# Altium schematic sheet DIOT_SMA_Supply.SchDoc: =DocumentName
size A4; ModifiedBy: -; CheckedDate: -; DivGrp: WUT ISE; Designer: G.Kasprowicz; DocumentNumber: 1; Revision: 0; SheetNumber: 6; SheetTotal: 17
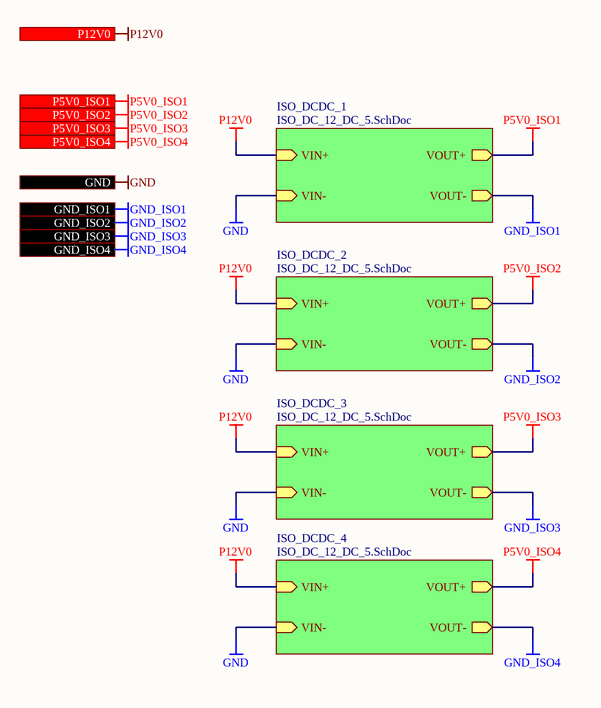
[diagram p0: DIOT_SMA_Supply.SchDoc]

## Sub-sheets
ISO_DCDC_1 = ISO_DC_12_DC_5.SchDoc: VIN+ (in), VIN- (in), VOUT+ (out), VOUT- (out)
ISO_DCDC_2 = ISO_DC_12_DC_5.SchDoc: VIN+ (in), VIN- (in), VOUT+ (out), VOUT- (out)
ISO_DCDC_3 = ISO_DC_12_DC_5.SchDoc: VIN+ (in), VIN- (in), VOUT+ (out), VOUT- (out)
ISO_DCDC_4 = ISO_DC_12_DC_5.SchDoc: VIN+ (in), VIN- (in), VOUT+ (out), VOUT- (out)

## Ports
GND, GND_ISO1, GND_ISO2, GND_ISO3, GND_ISO4, P5V0_ISO1 (out), P5V0_ISO2 (out), P5V0_ISO3 (out), P5V0_ISO4 (out), P12V0 (in)

## Nets
GND: port GND, sheet ISO_DCDC_1/VIN-, sheet ISO_DCDC_2/VIN-, sheet ISO_DCDC_3/VIN-, sheet ISO_DCDC_4/VIN-
GND_ISO1: port GND_ISO1, sheet ISO_DCDC_1/VOUT-
GND_ISO2: port GND_ISO2, sheet ISO_DCDC_2/VOUT-
GND_ISO3: port GND_ISO3, sheet ISO_DCDC_3/VOUT-
GND_ISO4: port GND_ISO4, sheet ISO_DCDC_4/VOUT-
P5V0_ISO1: port P5V0_ISO1, sheet ISO_DCDC_1/VOUT+
P5V0_ISO2: port P5V0_ISO2, sheet ISO_DCDC_2/VOUT+
P5V0_ISO3: port P5V0_ISO3, sheet ISO_DCDC_3/VOUT+
P5V0_ISO4: port P5V0_ISO4, sheet ISO_DCDC_4/VOUT+
P12V0: port P12V0, sheet ISO_DCDC_1/VIN+, sheet ISO_DCDC_2/VIN+, sheet ISO_DCDC_3/VIN+, sheet ISO_DCDC_4/VIN+

## Notes on the sheet
- Release
- Last modified =ModifiedDate
  Sheet =sheetnumber of =sheettotal · Size A4
- Copyright =P_copyright_owner
  This source describes Open Hardware and is licensed under the CERN-OHL-W v2. You may redistribute and modify this source and make products using it under the terms of the CERN-OHL-W v2 (https://cern.ch/cern-ohl). This source is distributed WITHOUT ANY EXPRESS OR IMPLIED WARRANTY, INCLUDING OF MERCHANTABILITY, SATISFACTORY QUALITY AND FITNESS FOR A PARTICULAR PURPOSE. Please see the CERN-OHL-W v2 for applicable conditions.
  Notice: If You produce hardware based on this source, You must maintain the Source Location visible on the product, its packaging or its documentation.
- SINARA OPEN HARDWARE
- OPEN HARDWARE FOR SCIENTIFIC INSTRUMENTATION
- https://github.com/sinara-hw
- Release owner
- Designers
- Reviewers
- Source location: